# Altium schematic sheet ESP32-C3_Sheet.SchDoc
size A4; SheetNumber: 9; SheetTotal: 12
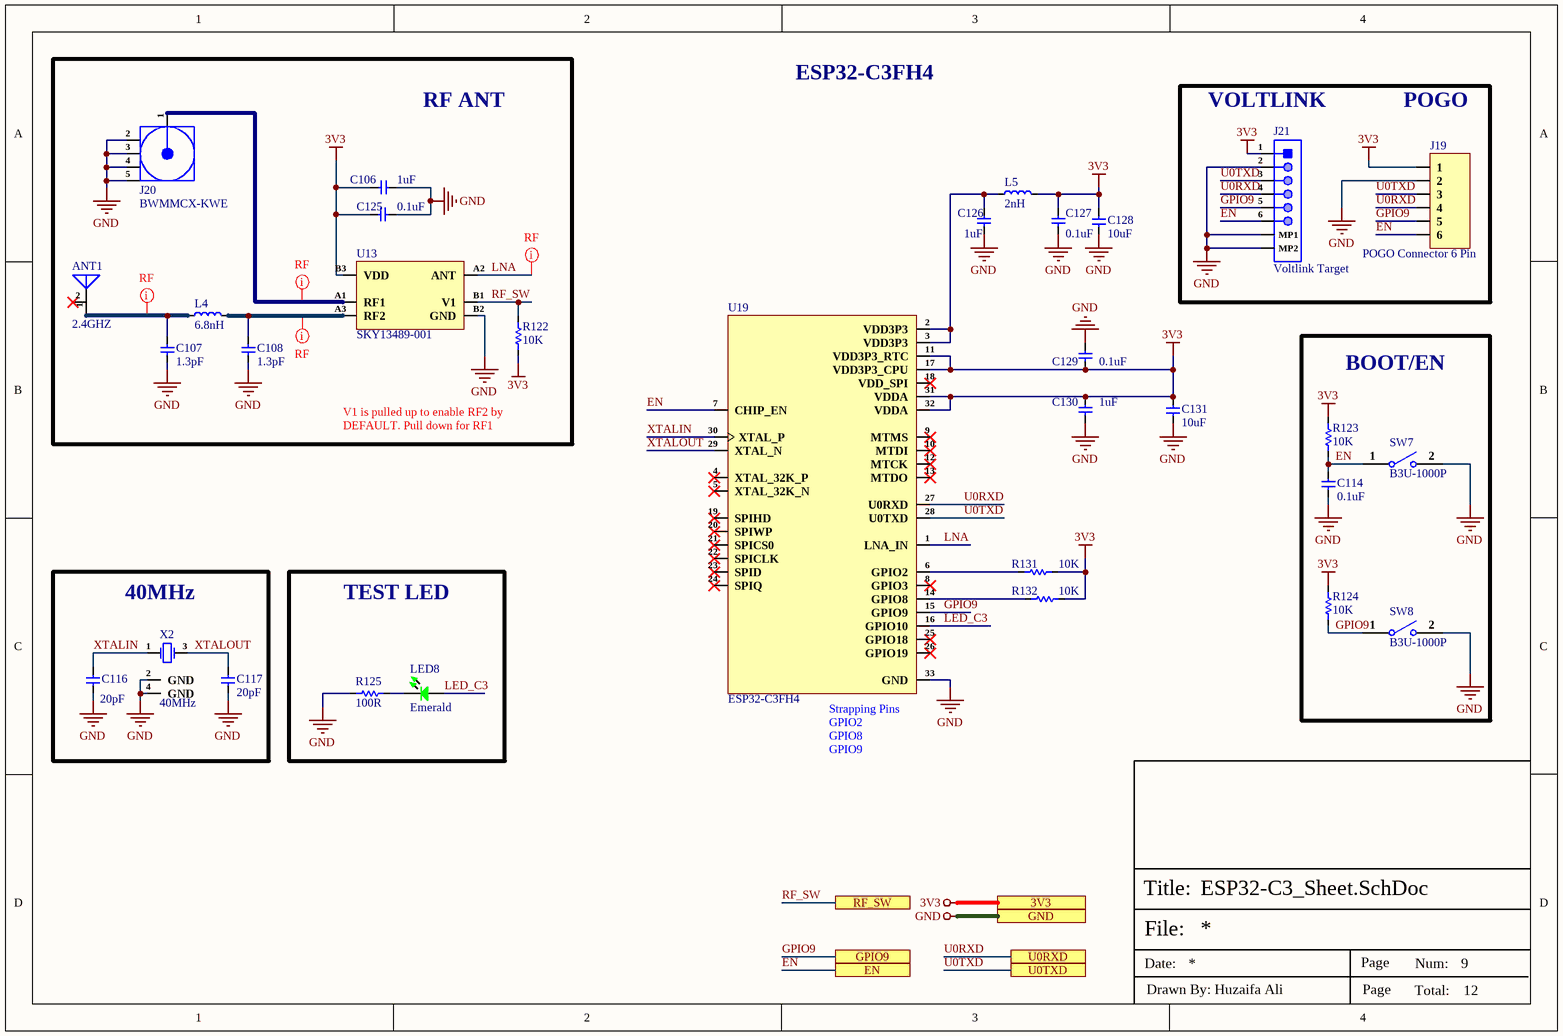
[diagram p0: ESP32-C3_Sheet.SchDoc]

## Parts
ANT1  2.4GHZ  [RFANT3216120A5T]
C106  1uF  [CAP-0201]
C107  1.3pF  [CAP-0201]
C108  1.3pF  [CAP-0201]
C114  0.1uF  [Cap-0402]
C116  20pF  [Cap-0603]
C117  20pF  [Cap-0603]
C125  0.1uF  [Cap-0402]
C126  1uF  [CAP-0201]
C127  0.1uF  [Cap-0402]
C128  10uF  [Cap-0402]
C129  0.1uF  [Cap-0402]
C130  1uF  [CAP-0201]
C131  10uF  [Cap-0402]
J19  POGO Connector 6 Pin  [POGO 6 Pin]
J20  BWMMCX-KWE  [BWMMCX-KWE]
J21  Voltlink Target  [Voltlink Target]
L4  6.8nH  [IND-0201]
L5  2nH  [IND-0603 (1608 Metric)]
LED8  Emerald  [LED-0603]
R122  10K  [Res-0201]
R123  10K  [Res-0201]
R124  10K  [Res-0201]
R125  100R  [Res-0402]
R131  10K  [Res-0201]
R132  10K  [Res-0201]
SW7  B3U-1000P  [B3U-1000P]
SW8  B3U-1000P  [B3U-1000P]
U13  SKY13489-001  [WLCSP-6(0.7x1.1)]
U19  ESP32-C3FH4  [32-QFN (5x5)]
X2  40MHz  [X322540MPB4SI_]

## Blocks framed on the sheet
RF ANT: ANT1 C106-C108 C125 J20 L4 R122 U13
BOOT/EN: C114 R123 R124 SW7 SW8
40MHz: C116 C117 X2
TEST LED: LED8 R125

## Ports
3V3, EN, GND, GPIO9, RF_SW, U0RXD, U0TXD

## Nets
3V3: C106.2 C125.1 C127.1 C128.2 C129.2 C130.1 C131.2 J19.1 J21.1 L5.2 R122.1 R123.2 R124.2 R131.1 R132.1 U13.B3(VDD) U19.11(VDD3P3_RTC) U19.17(VDD3P3_CPU) U19.31(VDDA) U19.32(VDDA) ; port 3V3
GND: C106.1 C107.1 C108.1 C114.2 C116.1 C117.1 C125.2 C126.2 C127.2 C128.1 C129.1 C130.2 C131.1 J19.2 J20.2(GND) J20.3(GND) J20.4(GND) J20.5(GND) J21.2 J21.MP1 J21.MP2 R125.1 SW7.2 SW8.2 U13.B2(GND) U19.33(GND) X2.2(GND) X2.4(GND) ; port GND
EN: C114.1 J19.6 J21.6 R123.1 SW7.1 U19.7(CHIP_EN) ; port EN
GPIO9: J19.5 J21.5 R124.1 SW8.1 U19.15(GPIO9) ; port GPIO9
LED_C3: LED8.1 U19.16(GPIO10)
LNA: U13.A2(ANT) U19.1(LNA_IN)
RF_SW: R122.2 U13.B1(V1) ; port RF_SW
U0RXD: J19.4 J21.4 U19.27(U0RXD) ; port U0RXD
U0TXD: J19.3 J21.3 U19.28(U0TXD) ; port U0TXD
XTALIN: C116.2 U19.30(XTAL_P) X2.1(CRYSTAL)
XTALOUT: C117.2 U19.29(XTAL_N) X2.3(CRYSTAL)
NetANT1_1: ANT1.1(A) C107.2 L4.1
NetC108_2: C108.2 L4.2 U13.A3(RF2)
NetC126_1: C126.1 L5.1 U19.2(VDD3P3) U19.3(VDD3P3)
NetJ20_1: J20.1(Signal) U13.A1(RF1)
NetLED8_2: LED8.2 R125.2
NetR131_2: R131.2 U19.6(GPIO2)
NetR132_2: R132.2 U19.14(GPIO8)

Not connected (* = marked no-connect by the designer): ANT1 2(NC)*; U19 4(XTAL_32K_P)* 5(XTAL_32K_N)* 8(GPIO3)* 9(MTMS)* 10(MTDI)* 12(MTCK)* 13(MTDO)* 18(VDD_SPI)* 19(SPIHD)* 20(SPIWP)* 21(SPICS0)* 22(SPICLK)* 23(SPID)* 24(SPIQ)* 25(GPIO18)* 26(GPIO19)*

## Layout directives
mark named RF: LNA, NetANT1_1, NetC108_2, NetJ20_1

## Notes on the sheet
- ESP32-C3FH4
- (near J21) VOLTLINK
- POGO
- V1 is pulled up to enable RF2 by DEFAULT. Pull down for RF1
- (near U19) Strapping Pins
  GPIO2
  GPIO8
  GPIO9
- File:
- Title:
- Date:
- Page
- Num:
- Total:
- Drawn By: Huzaifa Ali

## Library data of the parts
ANT1 = RFANT3216120A5T: 2.4GHZ CERAMIC CHIP ANTENNA; Manufacturer: Walsin Technologies; Bandwidth: 150MHz; Impedance: 50R; Number of Bands: 1; VSWR: 2; Supplier: Digikey; Supplier Part Number: 1292-1000-1-ND; Manufacturer Part Number: RFANT3216120A5T; RoHS: Yes; Category: RF Antennas; Stock: 28669; Pricing: 1=0.5, 10=0.403, 25=0.3692, 100=0.2747, 250=0.24896, 500=0.20604, 1000=0.15453 (USD); Mounting Technology: Surface Mount; Case/Package: CSMD; Pins: 2; Package Quantity: 2000; Packaging: Tape and Reel; Frequency: 2.4GHz; Termination: Solder; Series: -; Radiation Hardening: No; ComponentLink1URL: https://datasheet.ciiva.com/26865/getdatasheetpartid-490374-26865067.pdf?src-supplier=Verical; ComponentLink1Description: https://datasheet.ciiva.com/26865/getdatasheetpartid-490374-26865067.pdf?src-supplier=Verical; ComponentLink2URL: https://datasheet.ciiva.com/26233/1-2rfant3216120a5t-26233244.pdf?src-supplier=Digikey; ComponentLink2Description: https://datasheet.ciiva.com/26233/1-2rfant3216120a5t-26233244.pdf?src-supplier=Digikey; ComponentLink3URL: https://datasheet.ciiva.com/26233/1-2rfant3216120a5t-26233238.pdf?src-supplier=Digikey; ComponentLink3Description: https://datasheet.ciiva.com/26233/1-2rfant3216120a5t-26233238.pdf?src-supplier=Digikey; LCSC Part Number: C127629; Item Type: Antenna
C106 C126 C130 = CC0201MRX5R7BB105: CAP CER 1UF 16V X5R 0201; Manufacturer: Yageo; Item Type: Capacitor; Supplier: Digi-Key; Supplier Part Number: 13-CC0201MRX5R7BB105TR-ND; Manufacturer Part Number: CC0201MRX5R7BB105; RoHS: Yes; Category: Ceramic Capacitors; LCSC Part Number: C5182464
C107 C108 = GRM0335C1H1R3BA01D: CAP CER 1.3PF 50V C0G/NP0 0201; Manufacturer: Murata; Material: 4241ConductorMaterial; Temperature Coefficient: 30ppm/°C; Item Type: Capacitor; Supplier 1: Arrow Electronics; Manufacturer Part Number: GRM0335C1H1R3BA01D; RoHS: Yes; Category: Ceramic Capacitors; Stock 1: 135000; Pricing 1: 15000=0.0024, 30000=0.0022, 75000=0.0018, 105000=0.0016, 150000=0.0015 (USD); Height: 330um; ComponentLink1URL: https://datasheet.ciiva.com/6270/partnumbering-e-01-6270997.pdf?src-supplier=Digi-Key; ComponentLink1Description: https://datasheet.ciiva.com/6270/partnumbering-e-01-6270997.pdf?src-supplier=Digi-Key; ComponentLink2URL: https://datasheet.ciiva.com/6271/partnumbering-e-01-6271000.pdf?src-supplier=Digi-Key; ComponentLink2Description: https://datasheet.ciiva.com/6271/partnumbering-e-01-6271000.pdf?src-supplier=Digi-Key; ComponentLink3URL: https://datasheet.ciiva.com/6271/partnumbering-e-01-6271002.pdf?src-supplier=Digi-Key; ComponentLink3Description: https://datasheet.ciiva.com/6271/partnumbering-e-01-6271002.pdf?src-supplier=Digi-Key; Supplier Part Number 1: GRM0335C1H1R3BA01D; LCSC Part Number: C237529
C114 C125 C127 C129 = C1005X5R1H104K050BB: CAP CER 0.1UF 50V X5R 0402; Manufacturer: TDK; Dielectric Material: Ceramic; Capacitance: 100nF; Tolerance: 10%; Item Type: Capacitor; Supplier 1: Digi-Key; Manufacturer Part Number: C1005X5R1H104K050BB; Stock 1: 1455182; Pricing 1: 1=0.12, 10=0.09, 50=0.049, 100=0.04, 500=0.02858, 1000=0.02245, 2500=0.02041, 5000=0.01878 (USD); Mount: Surface Mount; Case/Package: 0402; Case Code (Metric): 1005; Case Code (Imperial): 0402; Weight: 2.3E-05oz; Min Operating Temperature: -55°C; Max Operating Temperature: 85°C; Dielectric: X5R; Voltage Rating: 50V; Packaging: Tape and Reel; Voltage Rating (DC): 50V; Termination: SMD/SMT; Construction: Flat; Package Quantity: 1; Resistor Type: Ceramic; Voltage: 50V; Series: C; Length: 1mm; Width: 0.02inch; Height: 0.5mm; Depth: 0.5mm; Thickness: 0.022inch; Radiation Hardening: No; Lead Free: Lead Free; REACH SVHC: No SVHC; RoHS Compliant: Yes; ComponentLink1URL: https://product.tdk.com/info/en/catalog/spec/mlccspec_commercial_general_midvoltage_en.pdf?src-supplier=Digi-Key; ComponentLink1Description: https://product.tdk.com/info/en/catalog/spec/mlccspec_commercial_general_midvoltage_en.pdf?src-supplier=Digi-Key; ComponentLink2URL: http://www.tdk.co.jp/tefe02/e413_c.pdf?src-supplier=Future+Electronics; ComponentLink2Description: http://www.tdk.co.jp/tefe02/e413_c.pdf?src-supplier=Future+Electronics; ComponentLink3URL: https://www.verical.com/server-webapp/html/getDatasheet?partID=743571&src-supplier=Verical; ComponentLink3Description: https://www.verical.com/server-webapp/html/getDatasheet?partID=743571&src-supplier=Verical; ComponentLink4URL: http://www.tdk.co.jp/tefe02/e412_c.pdf?src-supplier=Avnet+Europe; ComponentLink4Description: http://www.tdk.co.jp/tefe02/e412_c.pdf?src-supplier=Avnet+Europe; Supplier Part Number 1: 445-5942-1-ND; LCSC Part Number: C2181865
C116 C117 = CC0603JRNPO9BN200: CAP CER 20PF 50V C0G/NPO 0603; Manufacturer: Yageo; Tolerance: 5%; Dielectric: C0G; Item Type: Capacitor; Supplier 1: Digi-Key; Manufacturer Part Number: CC0603JRNPO9BN200; Stock 1: 259568; Pricing 1: 1=0.1, 10=0.048, 100=0.0214, 500=0.01526, 1000=0.01198 (USD); Mount: Surface Mount; Case/Package: 0603; Number of Pins: 2; Weight: 7.1E-05oz; Case Code (Imperial): 0603; Case Code (Metric): 1608; Min Operating Temperature: -55°C; Max Operating Temperature: 125°C; Capacitance: 20pF; Package Quantity: 4000; Voltage Rating (DC): 50V; Packaging: Tape and Reel; Voltage Rating: 50V; Termination: SMD/SMT; Composition: Ceramic; Length: 1.6mm; Width: 0.8mm; Thickness: 0.035inch; Depth: 0.8mm; REACH SVHC: Unknown; Lead Free: Lead Free; ComponentLink1URL: http://www.farnell.com/datasheets/1132289.pdf?src-supplier=Element14; ComponentLink1Description: http://www.farnell.com/datasheets/1132289.pdf?src-supplier=Element14; ComponentLink2URL: http://www.yageo.com/documents/recent/UPY-GP_NP0_16V-to-50V_16.pdf?src-supplier=Digi-Key; ComponentLink2Description: http://www.yageo.com/documents/recent/UPY-GP_NP0_16V-to-50V_16.pdf?src-supplier=Digi-Key; Supplier Part Number 1: 311-1424-6-ND; LCSC Part Number: C105621
C128 C131 = CC0402MRX5R6BB106: CAP CER 10UF 10V X5R 0402; Manufacturer: Yageo; Tolerance: 20%; Item Type: Capacitor; Supplier 1: Future Electronics; Manufacturer Part Number: CC0402MRX5R6BB106; RoHS: Yes; Category: Ceramic Capacitors; Stock 1: 80000; Pricing 1: 10000=0.02650, 20000=0.02590, 30000=0.02550, 40000=0.02530, 50000=0.02450 (USD); Mount: Surface Mount; Case/Package: 0402; Case Code (Imperial): 0402; Case Code (Metric): 1005; Min Operating Temperature: -55°C; Max Operating Temperature: 85°C; Packaging: Tape and Reel; Capacitance: 10uF; Voltage Rating: 10V; RoHS Compliant: Yes; ComponentLink1URL: http://www.yageo.com/documents/recent/UPY-GPHC_X5R_4V-to-50V_25.pdf?src-supplier=Digi-Key; ComponentLink1Description: http://www.yageo.com/documents/recent/UPY-GPHC_X5R_4V-to-50V_25.pdf?src-supplier=Digi-Key; Supplier Part Number 1: 6097631; LCSC Part Number: C962143
J19 = POGO Connector 6 Pin: Pogo Pad 2.5mm 6 Pin
J20 = BWMMCX-KWE: 1 Inner bore MCX/MMCX Board Edge Bend 6.8mm 6GHz 50Ω 3.45mm Plugin RF Connectors / Coaxial Connectors ROHS; Manufacturer: BAT WIRELESS; Manufacturer Part Number: BWMMCX-KWE; LCSC Part Number: C5137199; Item Type: Coaxial Connector; ComponentLink1Description: LCSC; ComponentLink1URL: https://www.lcsc.com/product-detail/RF-Connectors-Coaxial-Connectors_BAT-WIRELESS-BWMMCX-KWE_C5137199.html
J21 = C145963: 1x6P SH 1 1mm 6 SMD,P=1mm Wire To Board / Wire To Wire Connector ROHS; Manufacturer: BOOMELE; Manufacturer Part Number: C145963; Package: SMD,P=1mm; LCSC Part Number: C145963; Item Type: Connector; ComponentLink1Description: LCSC; ComponentLink1URL: https://www.lcsc.com/product-detail/Wire-To-Board-Wire-To-Wire-Connector_BOOMELE-Boom-Precision-Elec-C145963_C145963.html
L4 = LQP03TG6N8H02D: FIXED IND 6.8NH 200MA 1.15OHM SM; Manufacturer: Murata; Tolerance: 3%; Shielding: Unshielded; DC Resistance (DCR): 1.15R; Self Resonant Frequency: 5.4GHz; Test Frequency: 500MHz; Item Type: Inductor; Supplier: Digikey; Supplier Part Number: 490-LQP03TG6N8H02DCT-ND; Manufacturer Part Number: LQP03TG6N8H02D; RoHS: Yes; Category: Fixed Inductors; Stock: 13400; Pricing: 1=0.1, 10=0.025, 25=0.024, 50=0.0204, 100=0.0172, 250=0.01644, 500=0.01494, 1000=0.01255, 2500=0.01075 (USD); Mounting Technology: Surface Mount; Case/Package: 0201; Min Operating Temperature: -55°C; Max Operating Temperature: 125°C; Current Rating: 200mA; Packaging: Tape and Reel; Package Quantity: 15000; Value: 6.8nH; DC Current: 200mA; Series: LQP03TG_02; Technology: THIN FILM; Length: 0.024inch; Width: 0.012inch; Height - Seated (Max): 0.013inch; Depth: 0.33mm; Military Standard: Not; RoHS Compliant: Yes; ComponentLink1URL: https://datasheet.octopart.com/LQP03TG6N8H02D-Murata-datasheet-140317395.pdf?src-supplier=Farnell; ComponentLink1Description: https://datasheet.octopart.com/LQP03TG6N8H02D-Murata-datasheet-140317395.pdf?src-supplier=Farnell; ComponentLink2URL: https://search.murata.co.jp/Ceramy/image/img/P02/JELF243C-0016.pdf?src-supplier=Digikey; ComponentLink2Description: https://search.murata.co.jp/Ceramy/image/img/P02/JELF243C-0016.pdf?src-supplier=Digikey; LCSC Part Number: C86120
L5 = SDCL1608C2N0STDF: 2nH ±0.3nH 0603 Inductors; Manufacturer: Sunlord; Manufacturer Part Number: SDCL1608C2N0STDF; Footprint: 0603; ComponentLink1Description: LCSC; ComponentLink1URL: https://lcsc.com/product-detail/Inductors-SMD_Sunlord-SDCL1608C2N0STDF_C370234.html; Value: 2nH; LCSC Part Number: C370234
LED8 = NCD0603G2: Emerald 0603 Light Emitting Diodes (LED) ROHS; Manufacturer: Foshan NationStar Optoelectronics; Manufacturer Part Number: NCD0603G2; Package: 0603; LCSC Part Number: C87326; Item Type: LED; ComponentLink1Description: LCSC; ComponentLink1URL: https://www.lcsc.com/product-detail/Light-Emitting-Diodes-LED_Foshan-NationStar-Optoelectronics-NCD0603G2_C87326.html
R122-R124 R131 R132 = RC0201JR-0710KL: RES SMD 10K OHM 5% 1/20W 0201; Manufacturer: Yageo; Voltage Rating (DC): 25V; Power Rating: 50mW; Resistance: 10kR; Temperature Coefficient: 200ppm/°C; Case Code (Imperial): 0201; Case Code (Metric): 0603; Case/Package: 0201; Category: Chip SMD Resistors; Contact Plating: Tin,Matte; Depth: 0.3mm; Lead Free: Lead Free; Length: 0.6mm; Manufacturer Part Number: RC0201JR-0710KL; Max Operating Temperature: 125°C; Military Standard: Not; Min Operating Temperature: -55°C; Packaging: Tape and Reel; Radiation Hardening: No; REACH SVHC: Unknown; Resistor Type: Thick Film; Termination: SMD/SMT; Tolerance: 5%; Voltage Rating: 25V; ComponentLink1Description: New link; ComponentLink1URL: *; Supplier 1: Digi-Key; RoHS: Yes; Stock 1: 1488597; Pricing 1: 1=0.10000, 10=0.02600, 100=0.01050, 1000=0.00472, 2500=0.00410, 5000=0.00338 (USD); ComponentLink2URL: https://datasheet.ciiva.com/8891/pyu-rc0201-51-rohs-l-8-8891388.pdf?src-supplier=Avnet; ComponentLink2Description: https://datasheet.ciiva.com/8891/pyu-rc0201-51-rohs-l-8-8891388.pdf?src-supplier=Avnet; ComponentLink3URL: https://datasheet.ciiva.com/7672/1563626-7672253.pdf?src-supplier=Element14; ComponentLink3Description: https://datasheet.ciiva.com/7672/1563626-7672253.pdf?src-supplier=Element14; ComponentLink4URL: https://datasheet.ciiva.com/28405/pyu-rc0201-51-rohs-l-8-28405613.pdf?src-supplier=Avnet+Europe; ComponentLink4Description: https://datasheet.ciiva.com/28405/pyu-rc0201-51-rohs-l-8-28405613.pdf?src-supplier=Avnet+Europe; ComponentLink5URL: https://datasheet.ciiva.com/7672/1563626-7672254.pdf?src-supplier=Element14; ComponentLink5Description: https://datasheet.ciiva.com/7672/1563626-7672254.pdf?src-supplier=Element14; ComponentLink6URL: https://datasheet.ciiva.com/7660/1421516-7660810.pdf?src-supplier=Element14; ComponentLink6Description: https://datasheet.ciiva.com/7660/1421516-7660810.pdf?src-supplier=Element14; ComponentLink7URL: https://datasheet.ciiva.com/16856/pyu-rc0201-51-rohs-l-8-16856011.pdf?src-supplier=Avnet+Europe; ComponentLink7Description: https://datasheet.ciiva.com/16856/pyu-rc0201-51-rohs-l-8-16856011.pdf?src-supplier=Avnet+Europe; ComponentLink8URL: https://datasheet.ciiva.com/46391/1421516-46391291.pdf?src-supplier=Element14; ComponentLink8Description: https://datasheet.ciiva.com/46391/1421516-46391291.pdf?src-supplier=Element14; Supplier Part Number 1: 311-10KNCT-ND; LCSC Part Number: C138117
R125 = RC0402FR-07100RL: RES 100 OHM 1% 1/16W 0402; Manufacturer: Yageo; Power Rating: 62.5mW; Voltage Rating: 50V; Temperature Coefficient: 100ppm/°C; Max Power Dissipation: 63mW; Item Type: Resistor; Supplier 1: Mouser; Manufacturer Part Number: RC0402FR-07100RL; RoHS: Yes; Category: Chip SMD Resistors; Stock 1: 699545; Pricing 1: 1=0.10000, 10=0.01200, 50=0.01200, 100=0.00500, 1000=0.00300, 2500=0.00200, 10000=0.00100 (USD); Case/Package: 0402; Number of Pins: 2; Case Code (Imperial): 0402; Case Code (Metric): 1005; Size Code: 0402; Min Operating Temperature: -55°C; Max Operating Temperature: 155°C; Tolerance: 1%; Voltage Rating (DC): 50V; Resistance: 100R; Packaging: Tape and Reel; Termination: SMD/SMT; Resistor Type: Thick Film; Features: Moisture Resistant; Series: RC; Number of Terminations: 2; Resistance Tolerance: 1%; Construction: Rectangular; Technology: THICK FILM; Length: 1mm; Width: 0.5mm; Height: 0.32mm; Depth: 0.5mm; RoHS Compliant: Yes; REACH SVHC: No SVHC; Military Standard: Not; Lead Free: Lead Free; ComponentLink1URL: https://datasheet.ciiva.com/11808/0900766b80c66297-11808765.pdf?src-supplier=RSComponents; ComponentLink1Description: https://datasheet.ciiva.com/11808/0900766b80c66297-11808765.pdf?src-supplier=RSComponents; ComponentLink2URL: https://datasheet.ciiva.com/7849/1784430-7849810.pdf?src-supplier=Element14; ComponentLink2Description: https://datasheet.ciiva.com/7849/1784430-7849810.pdf?src-supplier=Element14; ComponentLink3URL: https://datasheet.ciiva.com/28367/1018594-28367226.pdf?src-supplier=Element14; ComponentLink3Description: https://datasheet.ciiva.com/28367/1018594-28367226.pdf?src-supplier=Element14; ComponentLink4URL: https://datasheet.ciiva.com/22747/1018594-22747511.pdf?src-supplier=Element14; ComponentLink4Description: https://datasheet.ciiva.com/22747/1018594-22747511.pdf?src-supplier=Element14; ComponentLink5URL: https://datasheet.ciiva.com/12667/pyu-rc0402-51-rohs-l-6-r-12667957.pdf?src-supplier=Mouser; ComponentLink5Description: https://datasheet.ciiva.com/12667/pyu-rc0402-51-rohs-l-6-r-12667957.pdf?src-supplier=Mouser; ComponentLink6URL: https://datasheet.ciiva.com/15189/getdatasheetpartid-329466-15189335.pdf?src-supplier=Verical; ComponentLink6Description: https://datasheet.ciiva.com/15189/getdatasheetpartid-329466-15189335.pdf?src-supplier=Verical; ComponentLink7URL: https://datasheet.ciiva.com/16740/pyu-rc0402-51-rohs-l-6-r-16740566.pdf?src-supplier=Future+Electronics; ComponentLink7Description: https://datasheet.ciiva.com/16740/pyu-rc0402-51-rohs-l-6-r-16740566.pdf?src-supplier=Future+Electronics; Supplier Part Number 1: 603-RC0402FR-07100RL; LCSC Part Number: C106232
SW7 SW8 = B3U-1000P: SWITCH TACTILE SPST-NO 0.05A 12V; Manufacturer: Omron; Mechanical Life: 200000Cycles; Operating Force: 1.5N; Throw Configuration: SPST; Current Rating: 50mA; Contact Resistance: 100mR; Illumination Type: Non-Illuminated,Illuminated; Switch Travel: 0.15mm; Switch Function: Off-Mom; Actuator Type: Standard; Actuator Length: 0.4mm; Ratings: Dust Proof,IP40; ComponentLink1URL: http://www.farnell.com/datasheets/60838.pdf?src-supplier=Farnell; ComponentLink1Description: http://www.farnell.com/datasheets/60838.pdf?src-supplier=Farnell; ComponentLink2URL: http://www.farnell.com/datasheets/60838.pdf?src-supplier=Element14; ComponentLink2Description: http://www.farnell.com/datasheets/60838.pdf?src-supplier=Element14; ComponentLink3URL: https://omronfs.omron.com/en_US/ecb/products/pdf/en-b3u.pdf?src-supplier=Digi-Key; ComponentLink3Description: https://omronfs.omron.com/en_US/ecb/products/pdf/en-b3u.pdf?src-supplier=Digi-Key; ComponentLink4URL: http://www.omron.com/ecb/products/pdf/en-b3u.pdf?src-supplier=Digi-Key; ComponentLink4Description: http://www.omron.com/ecb/products/pdf/en-b3u.pdf?src-supplier=Digi-Key; ComponentLink5URL: https://www.distrelec.biz/Web/Downloads/he/et/B3U_eng_datasheet.pdf?mime=application%2Fpdf&src-supplier=Distrelec; ComponentLink5Description: https://www.distrelec.biz/Web/Downloads/he/et/B3U_eng_datasheet.pdf?mime=application%2Fpdf&src-supplier=Distrelec; ComponentLink6URL: http://www.onlinecomponents.com/productFiles/mf-OM/en-b3u.pdf?src-supplier=Onlinecomponents.com; ComponentLink6Description: http://www.onlinecomponents.com/productFiles/mf-OM/en-b3u.pdf?src-supplier=Onlinecomponents.com; Supplier 1: Digi-Key; Manufacturer Part Number: B3U-1000P; Stock 1: 116454; Pricing 1: 1=1, 10=0.961, 25=0.9064, 50=0.7976, 100=0.7251, 250=0.68888, 500=0.67074, 1000=0.52571 (USD); Mount: Surface Mount; Weight: 0.000776oz; Contact Material: Silver; Min Operating Temperature: -25°C; Max Operating Temperature: 70°C; Packaging: Tape and Reel; Voltage Rating (DC): 12V; Package Quantity: 1; Max Current Rating: 50mA; Termination: SMD/SMT; Orientation: Straight; Max Voltage Rating (DC): 12V; Electrical Life: 200000Cycles; Insulation Resistance: 100MR; Contact Current Rating: 50mA; Length: 4mm; Height: 1.2mm; Depth: 2.5mm; Width: 3mm; REACH SVHC: Unknown; Lead Free: Lead Free; ComponentLink7URL: https://www.verical.com/server-webapp/html/getDatasheet?partID=552554&src-supplier=Verical; ComponentLink7Description: https://www.verical.com/server-webapp/html/getDatasheet?partID=552554&src-supplier=Verical; ComponentLink8URL: http://www.farnell.com/datasheets/1685550.pdf?src-supplier=Element14; ComponentLink8Description: http://www.farnell.com/datasheets/1685550.pdf?src-supplier=Element14; ComponentLink9URL: http://www.farnell.com/datasheets/2610940.pdf?src-supplier=Farnell; ComponentLink9Description: http://www.farnell.com/datasheets/2610940.pdf?src-supplier=Farnell; ComponentLink10URL: https://www.alliedelec.com/m/d/4c8a9ef82804fc3c241a13c1e298fd73.pdf?src-supplier=Allied+Electronics; ComponentLink10Description: https://www.alliedelec.com/m/d/4c8a9ef82804fc3c241a13c1e298fd73.pdf?src-supplier=Allied+Electronics; Supplier Part Number 1: SW1020DKR-ND; LCSC Part Number: C231329; Item Type: Switch
U13 = SKY13489-001: IC RF SWITCH SPDT 2.7GHZ 6WLCSP; Manufacturer: Skyworks Solutions; P1dB: 39dBm; Insertion Loss: 0.2dB; Supplier: Digikey; Supplier Part Number: 863-1809-1-ND; Manufacturer Part Number: SKY13489-001; RoHS: Yes; Category: RF Semiconductors and Devices; Stock: 3063; Pricing: 1=1.17, 10=1.049, 25=0.9956, 100=0.8177, 250=0.76436, 500=0.67548, 1000=0.53328, 2500=0.49773 (USD); Packaging: Cut Tape; Throw Configuration: SPDT; Series: -; Test Frequency: 2.7GHz; RoHS Compliant: Yes; ComponentLink1URL: http://www.skyworksinc.com/uploads/documents/SKY13489_001_202857C.pdf?src-supplier=Digikey; ComponentLink1Description: http://www.skyworksinc.com/uploads/documents/SKY13489_001_202857C.pdf?src-supplier=Digikey; ComponentLink2URL: https://www.skyworksinc.com/-/media/SkyWorks/Documents/Products/2201-2300/SKY13489_001_202857D.pdf?src-supplier=Digikey; ComponentLink2Description: https://www.skyworksinc.com/-/media/SkyWorks/Documents/Products/2201-2300/SKY13489_001_202857D.pdf?src-supplier=Digikey; LCSC Part Number: C429943; Item Type: IC
U19 = ESP32-C3FH4: RF TXRX MODULE BLUETOOTH SMD; Manufacturer: Espressif Systems; Item Type: IC; Supplier: Digikey; Supplier Part Number: 1904-ESP32-C3FH4CT-ND; Manufacturer Part Number: ESP32-C3FH4; RoHS: No; Category: Uncategorized; Stock: 7160; Pricing: 1=1.3 (USD); LCSC Part Number: C2858491
X2 = X322540MPB4SI: 40MHz SMD Crystal Resonator 15pF SMD3225-4P Crystals ROHS; Manufacturer: Yangxing Tech; Manufacturer Part Number: X322540MPB4SI; Value: 40MHZ; LCSC Part Number: C9010; ComponentLink1Description: LCSC; ComponentLink1URL: https://www.lcsc.com/product-detail/Crystals_Yangxing-Tech-X322540MPB4SI_C9010.html; Item Type: Crystal